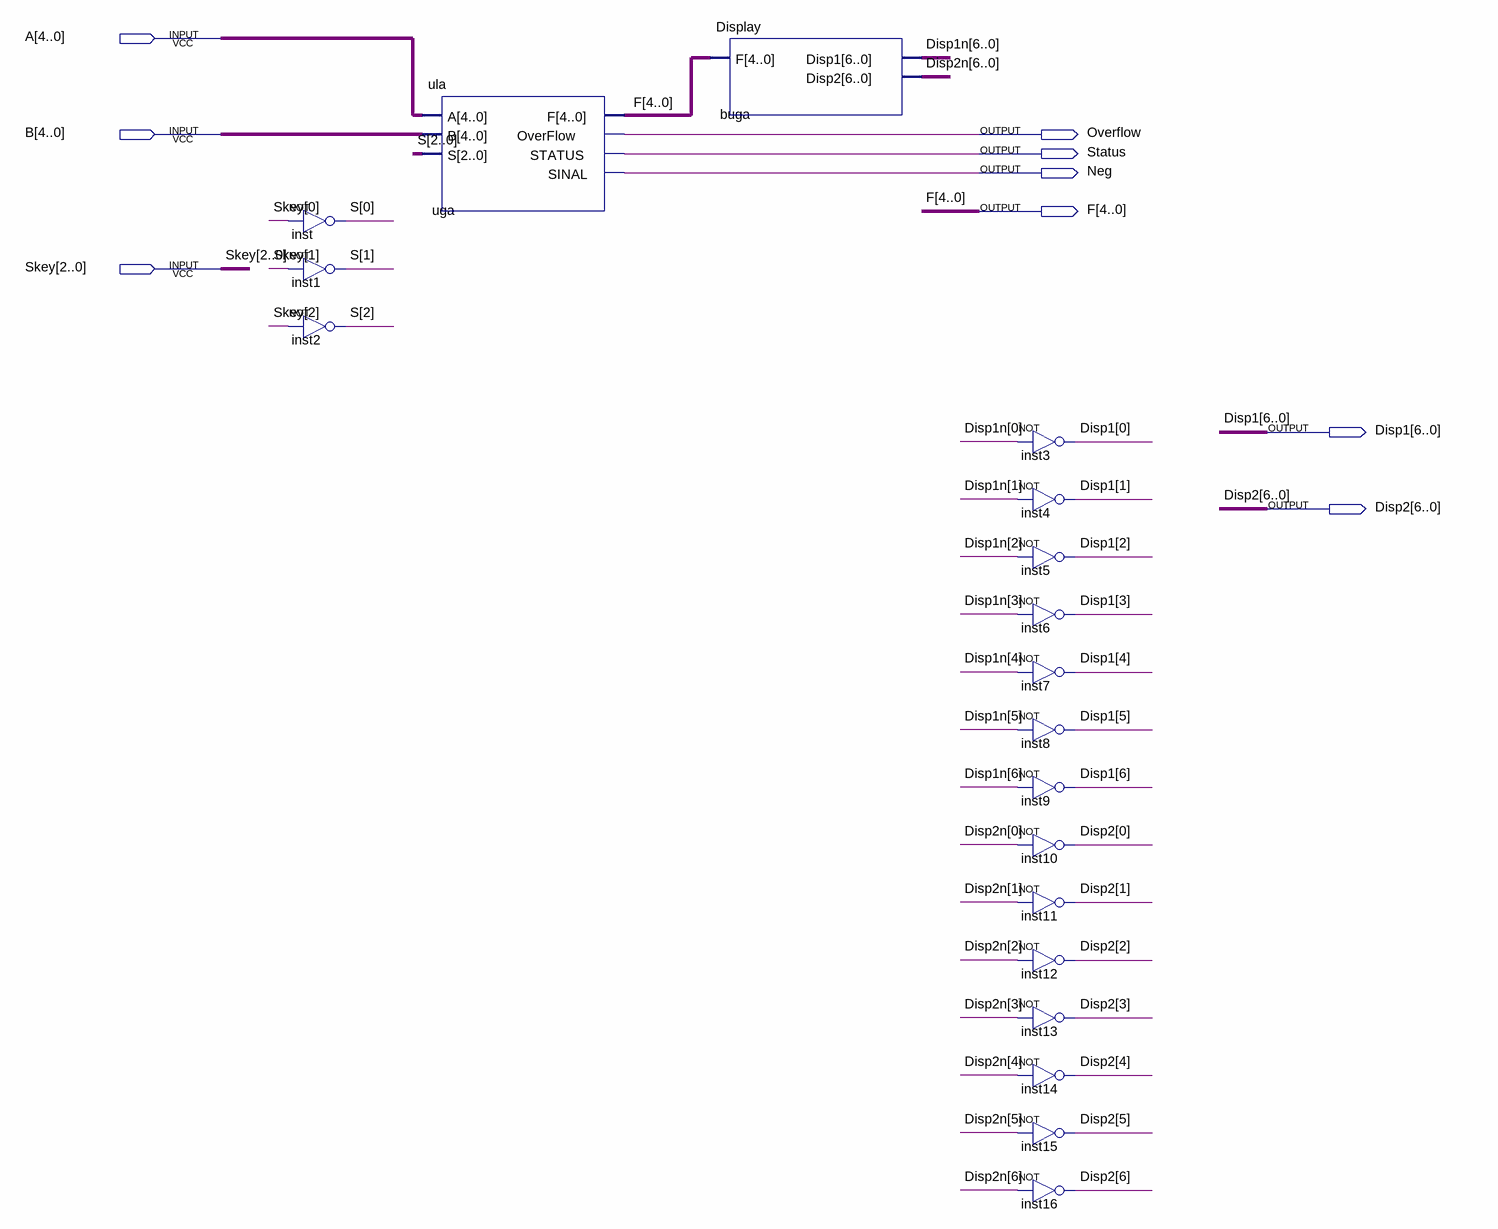
[diagram p0: schematic sheet]
// Quartus schematic Projeto_Completo.bdf as structural Verilog: 19 symbols, 9 pins
module Projeto_Completo (
  input  [4:0] A,
  input  [4:0] B,
  input  [2:0] Skey,
  output Overflow,
  output Status,
  output Neg,
  output [4:0] F,
  output [6:0] Disp1,
  output [6:0] Disp2
);

  wire [2:0] S;
  wire [6:0] Disp1n, Disp2n;

  not inst (S[0], Skey[0]);
  not inst1 (S[1], Skey[1]);
  not inst2 (S[2], Skey[2]);
  ula uga (.A(A), .B(B), .S(S), .F(F), .OverFlow(Overflow), .STATUS(Status), .SINAL(Neg));
  Display buga (.F(F), .Disp1(Disp1n), .Disp2(Disp2n));
  not inst3 (Disp1[0], Disp1n[0]);
  not inst4 (Disp1[1], Disp1n[1]);
  not inst5 (Disp1[2], Disp1n[2]);
  not inst6 (Disp1[3], Disp1n[3]);
  not inst7 (Disp1[4], Disp1n[4]);
  not inst8 (Disp1[5], Disp1n[5]);
  not inst9 (Disp1[6], Disp1n[6]);
  not inst10 (Disp2[0], Disp2n[0]);
  not inst11 (Disp2[1], Disp2n[1]);
  not inst12 (Disp2[2], Disp2n[2]);
  not inst13 (Disp2[3], Disp2n[3]);
  not inst14 (Disp2[4], Disp2n[4]);
  not inst15 (Disp2[5], Disp2n[5]);
  not inst16 (Disp2[6], Disp2n[6]);
endmodule
